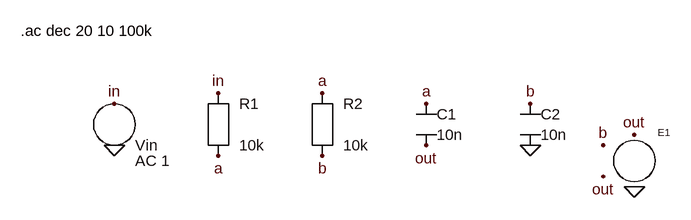
[diagram p0: schematic sallen_key_labelled.asc]
sallen_key_labelled.asc, the LTspice schematic file:
Version 4
SHEET 1 880 680
FLAG 160 128 in
FLAG 160 192 0
FLAG 320 112 in
FLAG 320 208 a
FLAG 480 112 a
FLAG 480 208 b
FLAG 640 128 a
FLAG 640 192 out
FLAG 800 128 b
FLAG 800 192 0
FLAG 960 176 out
FLAG 960 256 0
FLAG 912 192 b
FLAG 912 240 out
SYMBOL voltage 160 160 R0
SYMATTR InstName Vin
SYMATTR Value AC 1
SYMBOL res 320 160 R0
SYMATTR InstName R1
SYMATTR Value 10k
SYMBOL res 480 160 R0
SYMATTR InstName R2
SYMATTR Value 10k
SYMBOL cap 640 160 R0
SYMATTR InstName C1
SYMATTR Value 10n
SYMBOL cap 800 160 R0
SYMATTR InstName C2
SYMATTR Value 10n
SYMBOL e 960 160 R0
SYMATTR InstName E1
SYMATTR Value 1e5
TEXT 16 16 Left 2 !.ac dec 20 10 100k

The netlist it stands for:
* sallen_key_labelled.asc
Vin in 0 AC 1
R1 in a 10k
R2 a b 10k
C1 a out 10n
C2 b 0 10n
E1 out 0 b out 1e5
.ac dec 20 10 100k
.backanno
.end